# Altium schematic sheet supply.SchDoc
size A4; CompanyName: MCI Management Center Innsbruck; Address1: Universitätsstraße 15; Address2: A-6020 Innsbruck
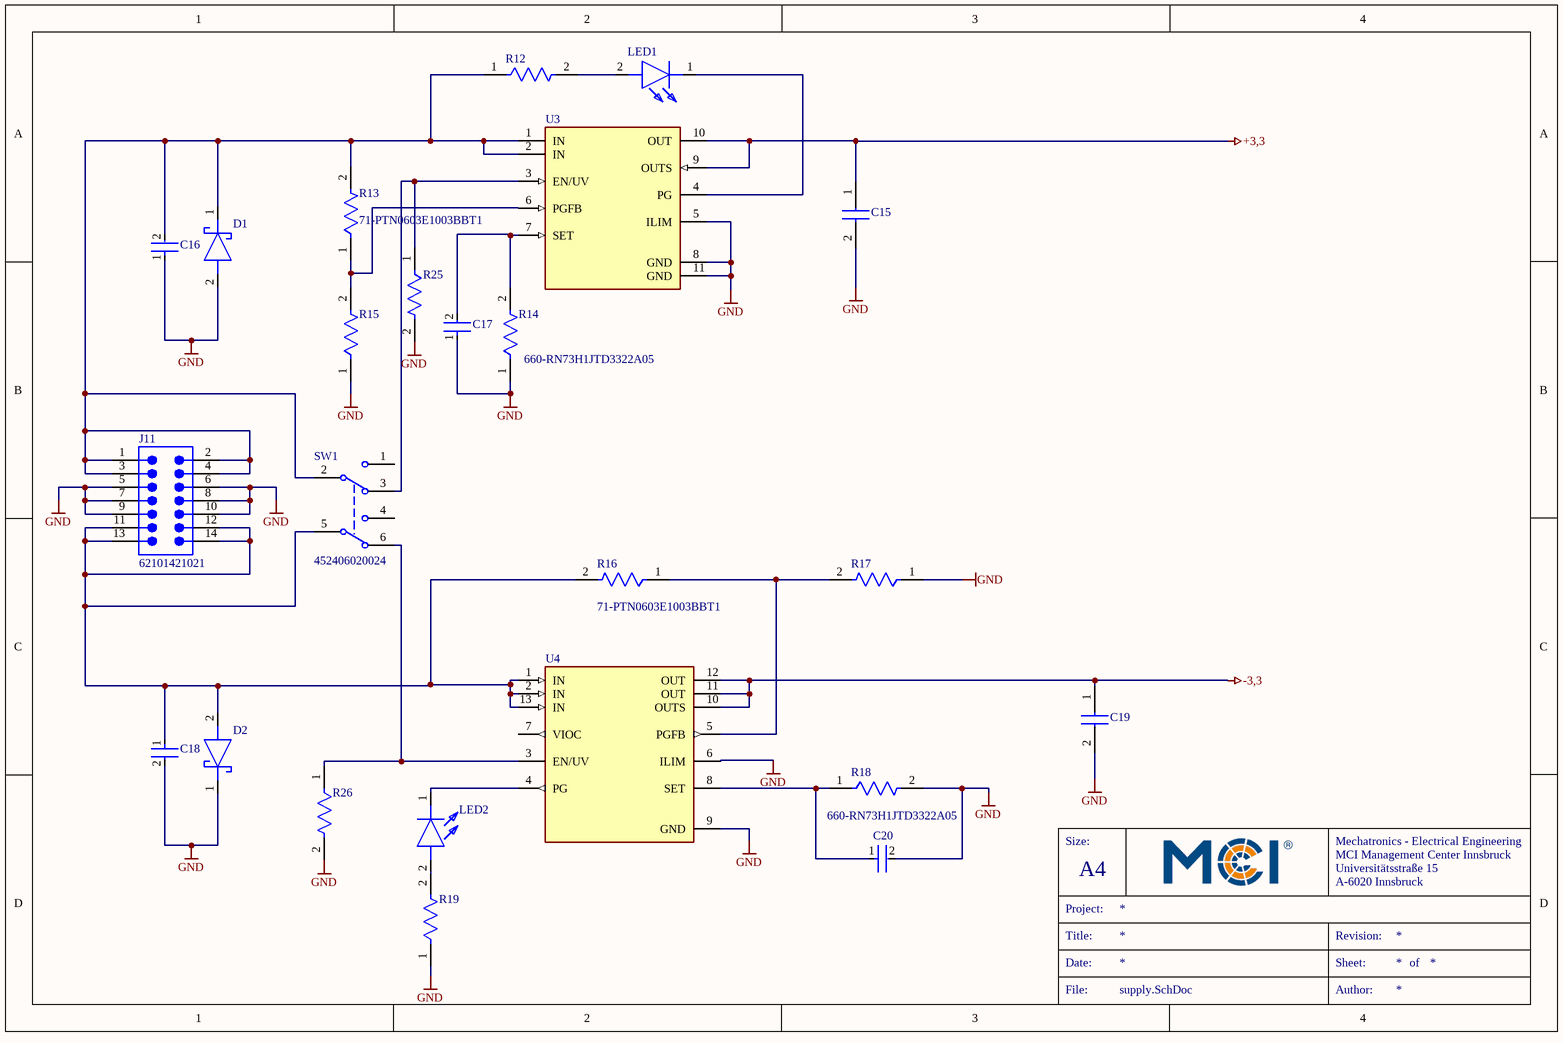
[diagram p0: supply.SchDoc]

## Parts
C15  MCASE31LBB7226MTNA01  [CAPC3214X190N]  (value not drawn)
C16  CGA4J1X7R1E475K125AE  [FP-CGA4J-IPC_A]  (value not drawn)
C17  CGA4J1X7R1E475K125AE  [FP-CGA4J-IPC_A]  (value not drawn)
C18  CGA4J1X7R1E475K125AE  [FP-CGA4J-IPC_A]  (value not drawn)
C19  MCASE31LBB7226MTNA01  [CAPC3214X190N]  (value not drawn)
C20  CGA4J1X7R1E475K125AE  [FP-CGA4J-IPC_A]  (value not drawn)
D1  RB521S-30  [SODFL1608X77N]  (value not drawn)
D2  RB521S-30  [SODFL1608X77N]  (value not drawn)
J11  62101421021  [62101421021]
LED1  APT1608SEC_J3-AMT  [APT1608SECJ3AMT]  (value not drawn)
LED2  APT1608SEC_J3-AMT  [APT1608SECJ3AMT]  (value not drawn)
R12  AC0402FR-7W1K2L  [FP-AC0402-IPC_A]  (value not drawn)
R13  Mouser Part Number: 71-PTN0603E1003BBT1  [FP-RT0603-MFG]  (hidden comment: RT0603BRE07100KL)
R14  Mouser Part Number: 660-RN73H1JTD3322A05  [FP-AT0603-IPC_B]  (hidden comment: AT0603FRE0733K2L)
R15  RT0603BRD1310KL  [FP-RT0603-MFG]  (value not drawn)
R16  Mouser Part Number: 71-PTN0603E1003BBT1  [FP-RT0603-MFG]  (hidden comment: RT0603BRE07100KL)
R17  RT0603BRD1310KL  [FP-RT0603-MFG]  (value not drawn)
R18  Mouser Part Number: 660-RN73H1JTD3322A05  [FP-AT0603-IPC_B]  (hidden comment: AT0603FRE0733K2L)
R19  AC0402FR-7W1K2L  [FP-AC0402-IPC_A]  (value not drawn)
R25  RT0603BRE07100KL  [FP-RT0603-MFG]  (value not drawn)
R26  RT0603BRE07100KL  [FP-RT0603-MFG]  (value not drawn)
SW1  452406020024  [452406020024]
U3  LT3045EDD#PBF  [FP-LT3045EDD#PBF-MFG]  (value not drawn)
U4  LT3094EDD#PBF  [FP-DD-12-05-08-1725-IPC_B]  (value not drawn)

## Nets
+3,3: C15.1 U3.9(OUTS) U3.10(OUT)
-3,3: C19.1 U4.10(OUTS) U4.11(OUT) U4.12(OUT)
GND: C15.2 C16.1 C17.1 C18.2 C19.2 C20.2 D1.2(A) D2.1(K) J11.5 J11.6 J11.7 J11.8 J11.9 J11.10 R14.1 R15.1 R17.1 R18.2 R19.1 R25.2 R26.2 U3.5(ILIM) U3.8(GND) U3.11(GND) U4.6(ILIM) U4.9(GND)
NetC16_2: C16.2 D1.1(K) J11.1 J11.2 J11.3 J11.4 R12.1 R13.2 SW1.2(COM) U3.1(IN) U3.2(IN)
NetC17_2: C17.2 R14.2 U3.7(SET)
NetC18_1: C18.1 D2.2(A) J11.11 J11.12 J11.13 J11.14 R16.2 SW1.5(COM) U4.1(IN) U4.2(IN) U4.13(IN)
NetC20_1: C20.1 R18.1 U4.8(SET)
NetLED1_1: LED1.1(K) U3.4(PG)
NetLED1_2: LED1.2(A) R12.2
NetLED2_1: LED2.1(K) U4.4(PG)
NetLED2_2: LED2.2(A) R19.2
NetR13_1: R13.1 R15.2 U3.6(PGFB)
NetR16_1: R16.1 R17.2 U4.5(PGFB)
NetR25_1: R25.1 SW1.3 U3.3(EN/UV)
NetR26_1: R26.1 SW1.6 U4.3(EN/UV)

Not connected (* = marked no-connect by the designer): SW1 1 4; U4 7(VIOC)

## Notes on the sheet
- Size:
- Mechatronics - Electrical Engineering
- Project:
- A4
- Title:
- Date:
- Revision:
- Sheet:
- of
- File:
- Author:

## Library data of the parts
C15 C19 = MCASE31LBB7226MTNA01: Capacitor; Manufacturer_Name: TAIYO YUDEN; Datasheet Link: https://www.mouser.in/datasheet/3/940/1/c_mlcc_C_e.pdf; Height: 1.9mm; Manufacturer_Part_Number: MCASE31LBB7226MTNA01
C16-C18 C20 = CMP-08246-002248-1: Cap Ceramic 4.7uF 25V X7R 10% Pad SMD 0805 +125°C Automotive T/R; Thickness: 0.059inch; Length: 0.079inch; Voltage Rating: 25V; Case Code (Metric): 2012; Min Operating Temperature: -55°C; Capacitance: 4.7uF; Mount: Surface Mount; Ratings: AEC-Q200; Packaging: Tape and Reel; Features: Soft Termination; Width: 0.047inch; Max Operating Temperature: 125°C; Tolerance: 10%; Case/Package: 0805; Case Code (Imperial): 0805
  C16: Parameter 1: *
D1 D2 = RB521S-30: Schottky Diode; Manufacturer_Name: Comchip Technology; Datasheet Link: https://www.mouser.in/datasheet/3/819/1/RB521S_30_RevC543202.pdf; Height: 0.77mm; Manufacturer_Part_Number: RB521S-30; Mouser Part Number: 750-RB521S-30; Mouser Price/Stock: https://www.mouser.co.uk/ProductDetail/Comchip-Technology/RB521S-30?qs=2qJf6qQ4IOKtVSsHa5L7cw%3D%3D
J11 = CMP-1502-00928-4: Conn, Header, 14Pos, 2Row, 1.27Mm Rohs Compliant: Yes; Contact Resistance: 20mΩ; Gender: Male; Current Rating: 1A; Operating Supply Voltage: 100V; Orientation: Vertical; RoHS: Non-Compliant; Lead Pitch: 1.27mm; Number of Pins: 14
LED1 LED2 = APT1608SEC_J3-AMT: LED; Manufacturer_Name: Kingbright; Manufacturer_Part_Number: APT1608SEC/J3-AMT; Datasheet Link: https://www.kingbrightusa.com/images/catalog/SPEC/APT1608SEC-J3-AMT.pdf; Height: 0.85mm; Mouser Part Number: 604-APT1608SEC/J3AMT; Mouser Price/Stock: https://www.mouser.co.uk/ProductDetail/Kingbright/APT1608SEC-J3-AMT?qs=0pUdBCiL%2F4PrQrm2zkbL8w%3D%3D; Arrow Part Number: APT1608SEC/J3-AMT; Arrow Price/Stock: https://www.arrow.com/en/products/apt1608secj3-amt/kingbright?utm_currency=USD&region=nac
R12 R19 = CMP-03412-048489-1: RES 1.2kΩ ±1% 0.125W 0402
R13 R16 R25 R26 = CMP-2000-04515-2: RES SMD 100K OHM 0.1% 1/10W 0603; Manufacturer: Yageo; Tolerance: 0.001; Voltage Rating: 75V; Resistance: 100KΩ; Temperature Coefficient: 50 ppm/°C; Value: 100KΩ; Power Rating: 0.1W; Device Class L1: Passive Components; Category: Res; Ipc Land Pattern Name: RESC16080X45; Footprint Url: http://www.yageo.com/exep/pages/download/literatures/PYu-R_Mount_10.pdf; Temperature Range Low: -55°C; Package: RT0603; Automotive: No; ComponentLink2URL: http://www.yageo.com/documents/recent/PYu-RT_1-to-0.01_RoHS_L_9.pdf; Composition: Thin Film; Manufacturer Part Number: RT0603BRE07100KL; Temperature Range High: +155°C; Octopart: https://octopart.com/rt0603bre07100kl-yageo-1377021; RoHS: TRUE; Series: RT; ComponentLink2Description: Datasheet; Device Class L2: Resistors; Device Class L3: Chip SMD Resistors; Lead Free: Yes; Digikey Description: RES SMD 100K OHM 0.1% 1/10W 0603; Temperature: -55°C to +155°C; Height: 0.55mm
R14 R18 = CMP-03412-041587-1: Thin Film Chip Resistors Automotive Grade 33.2kΩ 1% 50ppm/°C 0603; RoHS Compliant: Yes
R15 R17 = CMP-03412-009757-1: RT0603 10KΩ 0.1W 25 ppm/°C 0.10%; Manufacturer: Yageo; Voltage Rating: 75V; Tolerance: 0.001; Resistance: 10KΩ; Manufacturer Part Number: RT0603BRD1310KL; Category: Res; Device Class L2: Resistors; Lead Free: Yes; Footprint Url: http://www.yageo.com/exep/pages/download/literatures/PYu-R_Mount_10.pdf; Ipc Land Pattern Name: RESC16080X45; Octopart: https://octopart.com/rt0603brd1310kl-yageo-30512336; Composition: Thin Film; Temperature Coefficient: 25 ppm/°C; ComponentLink2Description: Datasheet; Temperature Range Low: -55°C; Temperature Range High: +155°C; Value: 10KΩ; Device Class L1: Passive Components; Package: RT0603; Power Rating: 0.1W; Automotive: No; ComponentLink2URL: http://www.yageo.com/documents/recent/PYu-RT_1-to-0.01_RoHS_L_9.pdf; Mouser Description: Res Thin Film 0603 10K Ohm 0.1% 1/10W ±25ppm/°C Molded SMD Paper T/R; Device Class L3: Chip SMD Resistors; Temperature: -55°C to +155°C; Height: 0.55mm; RoHS: TRUE; Series: RT
SW1 = CMP-03913-146831046-2: WS-SLSV Mini Slide Switch; Manufacturer Lifecycle Status: ACTIVE; Insulation Resistance: 100MΩ; YEOL: 1 = Estimated lifetime > 10 years; Max Operating Temperature: 85°C; RoHS: Compliant; Min Operating Temperature: -40°C; Contact Plating: Silver; Lifecycle Status: Production
U3 = CMP-09138-000240-1: IC REG LINEAR 0V 500MA 10DFN; Min Current Limit: 570mA; Number of Regulators: 1; Dropout Voltage: 260mV; Output Voltage: 15V; RoHS Compliant: Yes; Series: -; Output Current: 500mA; Case/Package: DFN; Max Operating Temperature: 125°C; Min Operating Temperature: -40°C
U4 = CMP-09138-000084-1: IC REG LIN NEG ADJ 500MA 12DFN; RoHS Compliant: Yes